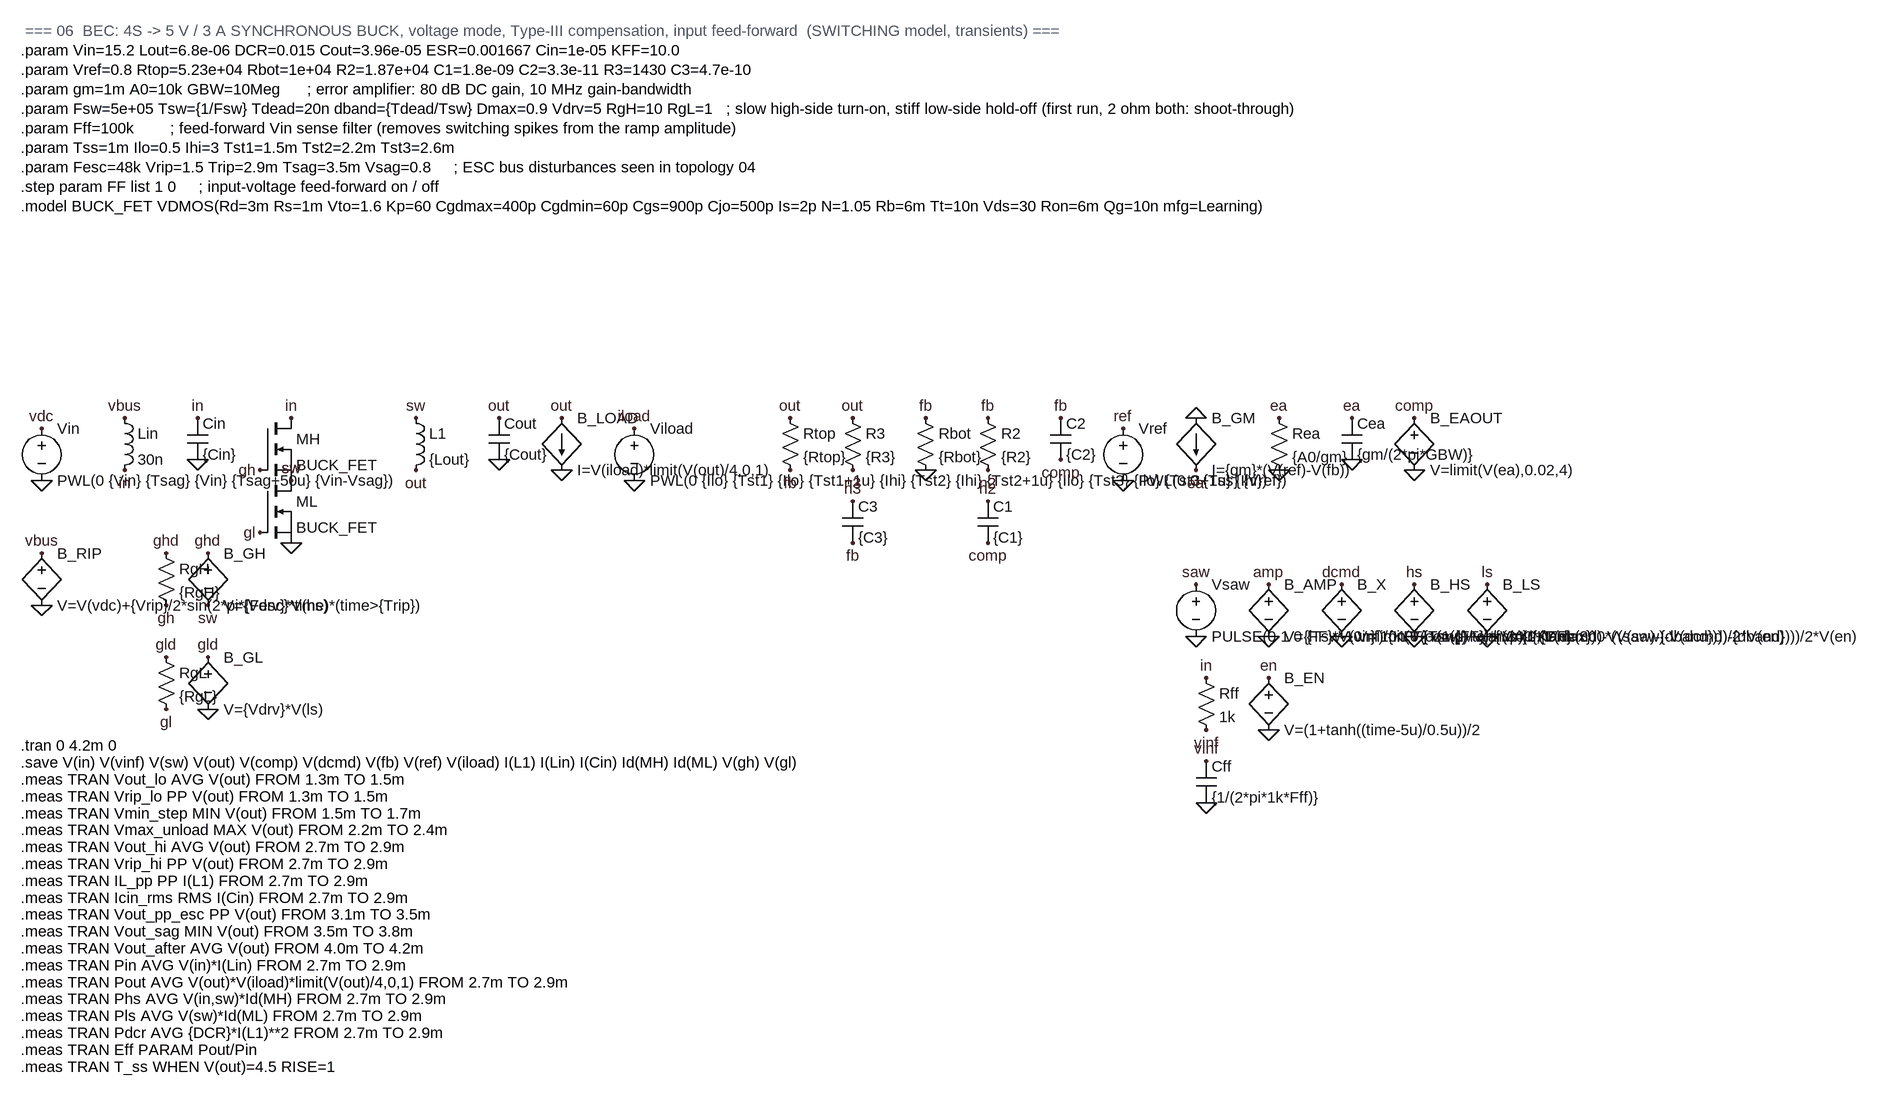
[diagram p0: schematic BEC_Buck.asc]
BEC_Buck.asc, the LTspice schematic file:
Version 4
SHEET 1 2400 1400
SYMBOL voltage 64 96 R0
SYMATTR InstName Vin
SYMATTR Value PWL(0 {Vin} {Tsag} {Vin} {Tsag+50u} {Vin-Vsag})
FLAG 64 112 vdc
FLAG 64 192 0
SYMBOL bv 64 288 R0
SYMATTR InstName B_RIP
SYMATTR Value V=V(vdc)+{Vrip}/2*sin(2*pi*{Fesc}*time)*(time>{Trip})
FLAG 64 304 vbus
FLAG 64 384 0
SYMBOL ind 176 80 R0
SYMATTR InstName Lin
SYMATTR Value 30n
SYMATTR SpiceLine Rser=5m
FLAG 192 96 vbus
FLAG 192 176 in
SYMBOL cap 288 96 R0
SYMATTR InstName Cin
SYMATTR Value {Cin}
SYMATTR SpiceLine Rser=3m Lser=0.5n
FLAG 304 96 in
FLAG 304 160 0
SYMBOL nmos 400 96 R0
SYMATTR InstName MH
SYMATTR Value BUCK_FET
FLAG 448 96 in
FLAG 400 176 gh
FLAG 448 192 sw
SYMBOL nmos 400 192 R0
SYMATTR InstName ML
SYMATTR Value BUCK_FET
FLAG 448 192 sw
FLAG 400 272 gl
FLAG 448 288 0
SYMBOL bv 320 288 R0
SYMATTR InstName B_GH
SYMATTR Value V={Vdrv}*V(hs)
FLAG 320 304 ghd
FLAG 320 384 sw
SYMBOL res 240 288 R0
SYMATTR InstName RgH
SYMATTR Value {RgH}
FLAG 256 304 ghd
FLAG 256 384 gh
SYMBOL bv 320 448 R0
SYMATTR InstName B_GL
SYMATTR Value V={Vdrv}*V(ls)
FLAG 320 464 gld
FLAG 320 544 0
SYMBOL res 240 448 R0
SYMATTR InstName RgL
SYMATTR Value {RgL}
FLAG 256 464 gld
FLAG 256 544 gl
SYMBOL ind 624 80 R0
SYMATTR InstName L1
SYMATTR Value {Lout}
SYMATTR SpiceLine Rser={DCR}
FLAG 640 96 sw
FLAG 640 176 out
SYMBOL cap 752 96 R0
SYMATTR InstName Cout
SYMATTR Value {Cout}
SYMATTR SpiceLine Rser={ESR} Lser=0.3n
FLAG 768 96 out
FLAG 768 160 0
SYMBOL bi 864 96 R0
SYMATTR InstName B_LOAD
SYMATTR Value I=V(iload)*limit(V(out)/4,0,1)
FLAG 864 96 out
FLAG 864 176 0
SYMBOL voltage 976 96 R0
SYMATTR InstName Viload
SYMATTR Value PWL(0 {Ilo} {Tst1} {Ilo} {Tst1+1u} {Ihi} {Tst2} {Ihi} {Tst2+1u} {Ilo} {Tst3} {Ilo} {Tst3+1u} {Ihi})
FLAG 976 112 iload
FLAG 976 192 0
SYMBOL res 1200 80 R0
SYMATTR InstName Rtop
SYMATTR Value {Rtop}
FLAG 1216 96 out
FLAG 1216 176 fb
SYMBOL res 1296 80 R0
SYMATTR InstName R3
SYMATTR Value {R3}
FLAG 1312 96 out
FLAG 1312 176 n3
SYMBOL cap 1296 224 R0
SYMATTR InstName C3
SYMATTR Value {C3}
FLAG 1312 224 n3
FLAG 1312 288 fb
SYMBOL res 1408 80 R0
SYMATTR InstName Rbot
SYMATTR Value {Rbot}
FLAG 1424 96 fb
FLAG 1424 176 0
SYMBOL res 1504 80 R0
SYMATTR InstName R2
SYMATTR Value {R2}
FLAG 1520 96 fb
FLAG 1520 176 n2
SYMBOL cap 1504 224 R0
SYMATTR InstName C1
SYMATTR Value {C1}
FLAG 1520 224 n2
FLAG 1520 288 comp
SYMBOL cap 1616 96 R0
SYMATTR InstName C2
SYMATTR Value {C2}
FLAG 1632 96 fb
FLAG 1632 160 comp
SYMBOL voltage 1728 96 R0
SYMATTR InstName Vref
SYMATTR Value PWL(0 0 {Tss} {Vref})
FLAG 1728 112 ref
FLAG 1728 192 0
SYMBOL bi 1840 96 R0
SYMATTR InstName B_GM
SYMATTR Value I={gm}*(V(ref)-V(fb))
FLAG 1840 96 0
FLAG 1840 176 ea
SYMBOL res 1952 80 R0
SYMATTR InstName Rea
SYMATTR Value {A0/gm}
FLAG 1968 96 ea
FLAG 1968 176 0
SYMBOL cap 2064 96 R0
SYMATTR InstName Cea
SYMATTR Value {gm/(2*pi*GBW)}
FLAG 2080 96 ea
FLAG 2080 160 0
SYMBOL bv 2176 80 R0
SYMATTR InstName B_EAOUT
SYMATTR Value V=limit(V(ea),0.02,4)
FLAG 2176 96 comp
FLAG 2176 176 0
SYMBOL voltage 1840 336 R0
SYMATTR InstName Vsaw
SYMATTR Value PULSE(0 1 0 {Tsw-10n} 10n 0 {Tsw})
FLAG 1840 352 saw
FLAG 1840 432 0
SYMBOL bv 1952 336 R0
SYMATTR InstName B_AMP
SYMATTR Value V={FF}*V(vinf)/{KFF}+(1-{FF})*{Vin}/{KFF}
FLAG 1952 352 amp
FLAG 1952 432 0
SYMBOL res 1840 480 R0
SYMATTR InstName Rff
SYMATTR Value 1k
FLAG 1856 496 in
FLAG 1856 576 vinf
SYMBOL cap 1840 624 R0
SYMATTR InstName Cff
SYMATTR Value {1/(2*pi*1k*Fff)}
FLAG 1856 624 vinf
FLAG 1856 688 0
SYMBOL bv 1952 480 R0
SYMATTR InstName B_EN
SYMATTR Value V=(1+tanh((time-5u)/0.5u))/2
FLAG 1952 496 en
FLAG 1952 576 0
SYMBOL bv 2064 336 R0
SYMATTR InstName B_X
SYMATTR Value V=limit(V(comp)/V(amp),0,{Dmax})
FLAG 2064 352 dcmd
FLAG 2064 432 0
SYMBOL bv 2176 336 R0
SYMATTR InstName B_HS
SYMATTR Value V=(1+tanh(300*(V(dcmd)-V(saw)-{dband})))/2*V(en)
FLAG 2176 352 hs
FLAG 2176 432 0
SYMBOL bv 2288 336 R0
SYMATTR InstName B_LS
SYMATTR Value V=(1+tanh(300*(V(saw)-V(dcmd)-{dband})))/2*V(en)
FLAG 2288 352 ls
FLAG 2288 432 0
TEXT 32 -500 Left 2 ; === 06  BEC: 4S -> 5 V / 3 A SYNCHRONOUS BUCK, voltage mode, Type-III compensation, input feed-forward  (SWITCHING model, transients) ===
TEXT 32 -470 Left 2 !.param Vin=15.2 Lout=6.8e-06 DCR=0.015 Cout=3.96e-05 ESR=0.001667 Cin=1e-05 KFF=10.0
TEXT 32 -440 Left 2 !.param Vref=0.8 Rtop=5.23e+04 Rbot=1e+04 R2=1.87e+04 C1=1.8e-09 C2=3.3e-11 R3=1430 C3=4.7e-10
TEXT 32 -410 Left 2 !.param gm=1m A0=10k GBW=10Meg      ; error amplifier: 80 dB DC gain, 10 MHz gain-bandwidth
TEXT 32 -380 Left 2 !.param Fsw=5e+05 Tsw={1/Fsw} Tdead=20n dband={Tdead/Tsw} Dmax=0.9 Vdrv=5 RgH=10 RgL=1   ; slow high-side turn-on, stiff low-side hold-off (first run, 2 ohm both: shoot-through)
TEXT 32 -350 Left 2 !.param Fff=100k        ; feed-forward Vin sense filter (removes switching spikes from the ramp amplitude)
TEXT 32 -320 Left 2 !.param Tss=1m Ilo=0.5 Ihi=3 Tst1=1.5m Tst2=2.2m Tst3=2.6m
TEXT 32 -290 Left 2 !.param Fesc=48k Vrip=1.5 Trip=2.9m Tsag=3.5m Vsag=0.8     ; ESC bus disturbances seen in topology 04
TEXT 32 -260 Left 2 !.step param FF list 1 0     ; input-voltage feed-forward on / off
TEXT 32 -230 Left 2 !.model BUCK_FET VDMOS(Rd=3m Rs=1m Vto=1.6 Kp=60 Cgdmax=400p Cgdmin=60p Cgs=900p Cjo=500p Is=2p N=1.05 Rb=6m Tt=10n Vds=30 Ron=6m Qg=10n mfg=Learning)
TEXT 32 600 Left 2 !.tran 0 4.2m 0
TEXT 32 626 Left 2 !.save V(in) V(vinf) V(sw) V(out) V(comp) V(dcmd) V(fb) V(ref) V(iload) I(L1) I(Lin) I(Cin) Id(MH) Id(ML) V(gh) V(gl)
TEXT 32 652 Left 2 !.meas TRAN Vout_lo AVG V(out) FROM 1.3m TO 1.5m
TEXT 32 678 Left 2 !.meas TRAN Vrip_lo PP V(out) FROM 1.3m TO 1.5m
TEXT 32 704 Left 2 !.meas TRAN Vmin_step MIN V(out) FROM 1.5m TO 1.7m
TEXT 32 730 Left 2 !.meas TRAN Vmax_unload MAX V(out) FROM 2.2m TO 2.4m
TEXT 32 756 Left 2 !.meas TRAN Vout_hi AVG V(out) FROM 2.7m TO 2.9m
TEXT 32 782 Left 2 !.meas TRAN Vrip_hi PP V(out) FROM 2.7m TO 2.9m
TEXT 32 808 Left 2 !.meas TRAN IL_pp PP I(L1) FROM 2.7m TO 2.9m
TEXT 32 834 Left 2 !.meas TRAN Icin_rms RMS I(Cin) FROM 2.7m TO 2.9m
TEXT 32 860 Left 2 !.meas TRAN Vout_pp_esc PP V(out) FROM 3.1m TO 3.5m
TEXT 32 886 Left 2 !.meas TRAN Vout_sag MIN V(out) FROM 3.5m TO 3.8m
TEXT 32 912 Left 2 !.meas TRAN Vout_after AVG V(out) FROM 4.0m TO 4.2m
TEXT 32 938 Left 2 !.meas TRAN Pin AVG V(in)*I(Lin) FROM 2.7m TO 2.9m
TEXT 32 964 Left 2 !.meas TRAN Pout AVG V(out)*V(iload)*limit(V(out)/4,0,1) FROM 2.7m TO 2.9m
TEXT 32 990 Left 2 !.meas TRAN Phs AVG V(in,sw)*Id(MH) FROM 2.7m TO 2.9m
TEXT 32 1016 Left 2 !.meas TRAN Pls AVG V(sw)*Id(ML) FROM 2.7m TO 2.9m
TEXT 32 1042 Left 2 !.meas TRAN Pdcr AVG {DCR}*I(L1)**2 FROM 2.7m TO 2.9m
TEXT 32 1068 Left 2 !.meas TRAN Eff PARAM Pout/Pin
TEXT 32 1094 Left 2 !.meas TRAN T_ss WHEN V(out)=4.5 RISE=1

The netlist it stands for:
* BEC_Buck.asc
Vin vdc 0 PWL(0 {Vin} {Tsag} {Vin} {Tsag+50u} {Vin-Vsag})
B_RIP vbus 0 V=V(vdc)+{Vrip}/2*sin(2*pi*{Fesc}*time)*(time>{Trip})
Lin vbus in 30n Rser=5m
Cin in 0 {Cin} Rser=3m Lser=0.5n
MH in gh sw sw BUCK_FET
ML sw gl 0 0 BUCK_FET
B_GH ghd sw V={Vdrv}*V(hs)
RgH ghd gh {RgH}
B_GL gld 0 V={Vdrv}*V(ls)
RgL gld gl {RgL}
L1 sw out {Lout} Rser={DCR}
Cout out 0 {Cout} Rser={ESR} Lser=0.3n
B_LOAD out 0 I=V(iload)*limit(V(out)/4,0,1)
Viload iload 0 PWL(0 {Ilo} {Tst1} {Ilo} {Tst1+1u} {Ihi} {Tst2} {Ihi} {Tst2+1u} {Ilo} {Tst3} {Ilo} {Tst3+1u} {Ihi})
Rtop out fb {Rtop}
R3 out n3 {R3}
C3 n3 fb {C3}
Rbot fb 0 {Rbot}
R2 fb n2 {R2}
C1 n2 comp {C1}
C2 fb comp {C2}
Vref ref 0 PWL(0 0 {Tss} {Vref})
B_GM 0 ea I={gm}*(V(ref)-V(fb))
Rea ea 0 {A0/gm}
Cea ea 0 {gm/(2*pi*GBW)}
B_EAOUT comp 0 V=limit(V(ea),0.02,4)
Vsaw saw 0 PULSE(0 1 0 {Tsw-10n} 10n 0 {Tsw})
B_AMP amp 0 V={FF}*V(vinf)/{KFF}+(1-{FF})*{Vin}/{KFF}
Rff in vinf 1k
Cff vinf 0 {1/(2*pi*1k*Fff)}
B_EN en 0 V=(1+tanh((time-5u)/0.5u))/2
B_X dcmd 0 V=limit(V(comp)/V(amp),0,{Dmax})
B_HS hs 0 V=(1+tanh(300*(V(dcmd)-V(saw)-{dband})))/2*V(en)
B_LS ls 0 V=(1+tanh(300*(V(saw)-V(dcmd)-{dband})))/2*V(en)
.model NMOS NMOS
.model PMOS PMOS
.lib standard.mos
*  === 06  BEC: 4S -> 5 V / 3 A SYNCHRONOUS BUCK, voltage mode, Type-III compensation, input feed-forward  (SWITCHING model, transients) ===
.param Vin=15.2 Lout=6.8e-06 DCR=0.015 Cout=3.96e-05 ESR=0.001667 Cin=1e-05 KFF=10.0
.param Vref=0.8 Rtop=5.23e+04 Rbot=1e+04 R2=1.87e+04 C1=1.8e-09 C2=3.3e-11 R3=1430 C3=4.7e-10
.param gm=1m A0=10k GBW=10Meg      ; error amplifier: 80 dB DC gain, 10 MHz gain-bandwidth
.param Fsw=5e+05 Tsw={1/Fsw} Tdead=20n dband={Tdead/Tsw} Dmax=0.9 Vdrv=5 RgH=10 RgL=1   ; slow high-side turn-on, stiff low-side hold-off (first run, 2 ohm both: shoot-through)
.param Fff=100k        ; feed-forward Vin sense filter (removes switching spikes from the ramp amplitude)
.param Tss=1m Ilo=0.5 Ihi=3 Tst1=1.5m Tst2=2.2m Tst3=2.6m
.param Fesc=48k Vrip=1.5 Trip=2.9m Tsag=3.5m Vsag=0.8     ; ESC bus disturbances seen in topology 04
.step param FF list 1 0     ; input-voltage feed-forward on / off
.model BUCK_FET VDMOS(Rd=3m Rs=1m Vto=1.6 Kp=60 Cgdmax=400p Cgdmin=60p Cgs=900p Cjo=500p Is=2p N=1.05 Rb=6m Tt=10n Vds=30 Ron=6m Qg=10n mfg=Learning)
.tran 0 4.2m 0
.save V(in) V(vinf) V(sw) V(out) V(comp) V(dcmd) V(fb) V(ref) V(iload) I(L1) I(Lin) I(Cin) Id(MH) Id(ML) V(gh) V(gl)
.meas TRAN Vout_lo AVG V(out) FROM 1.3m TO 1.5m
.meas TRAN Vrip_lo PP V(out) FROM 1.3m TO 1.5m
.meas TRAN Vmin_step MIN V(out) FROM 1.5m TO 1.7m
.meas TRAN Vmax_unload MAX V(out) FROM 2.2m TO 2.4m
.meas TRAN Vout_hi AVG V(out) FROM 2.7m TO 2.9m
.meas TRAN Vrip_hi PP V(out) FROM 2.7m TO 2.9m
.meas TRAN IL_pp PP I(L1) FROM 2.7m TO 2.9m
.meas TRAN Icin_rms RMS I(Cin) FROM 2.7m TO 2.9m
.meas TRAN Vout_pp_esc PP V(out) FROM 3.1m TO 3.5m
.meas TRAN Vout_sag MIN V(out) FROM 3.5m TO 3.8m
.meas TRAN Vout_after AVG V(out) FROM 4.0m TO 4.2m
.meas TRAN Pin AVG V(in)*I(Lin) FROM 2.7m TO 2.9m
.meas TRAN Pout AVG V(out)*V(iload)*limit(V(out)/4,0,1) FROM 2.7m TO 2.9m
.meas TRAN Phs AVG V(in,sw)*Id(MH) FROM 2.7m TO 2.9m
.meas TRAN Pls AVG V(sw)*Id(ML) FROM 2.7m TO 2.9m
.meas TRAN Pdcr AVG {DCR}*I(L1)**2 FROM 2.7m TO 2.9m
.meas TRAN Eff PARAM Pout/Pin
.meas TRAN T_ss WHEN V(out)=4.5 RISE=1
.backanno
.end